# Altium schematic sheet ffultra_pyro.SchDoc: Pyro Channel
size A4; ApprovedBy: John Pork; CheckedBy: Michael Mannis; Author: Michael Mannis; DocumentNumber: 1.0; Revision: 1; SheetNumber: 10; SheetTotal: 12
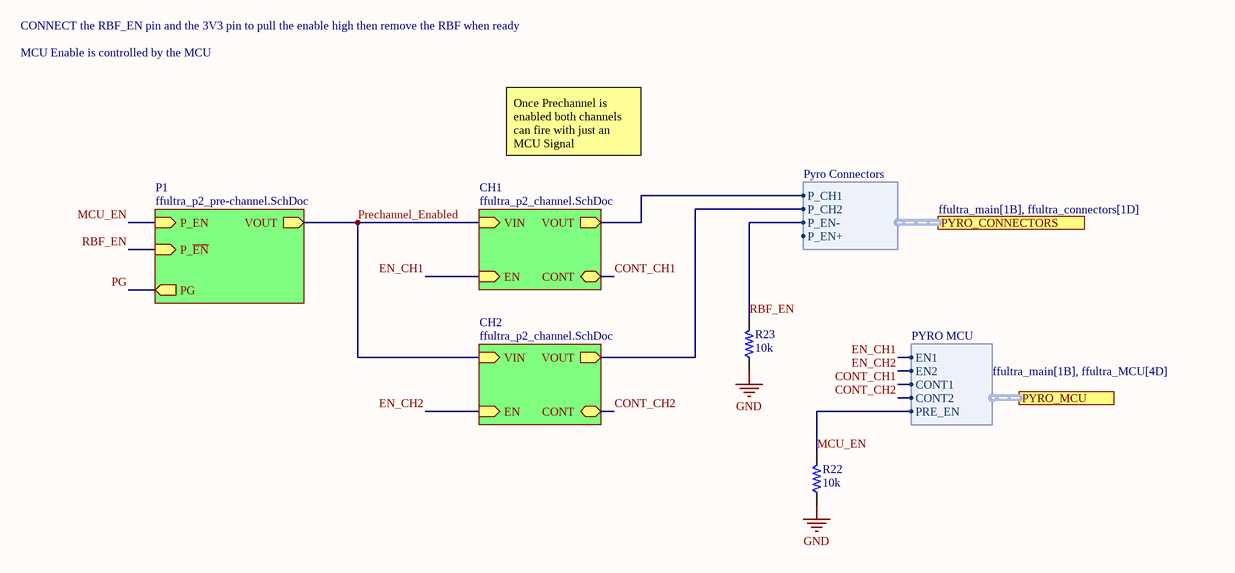
[diagram p0: ffultra_pyro.SchDoc]

## Parts
R22  value 10k  [RES-0402]  (hidden comment: 0402WGF1002TCE)
R23  value 10k  [RES-0402]  (hidden comment: 0402WGF1002TCE)

## Sub-sheets
CH1 = ffultra_p2_channel.SchDoc: VOUT (out), VIN (in), CONT (bidir), EN (in)
CH2 = ffultra_p2_channel.SchDoc: VOUT (out), VIN (in), EN (in), CONT (bidir)
P1 = ffultra_p2_pre-channel.SchDoc: VOUT (out), P_EN (in), P_~{EN} (in), PG (out)

## Ports
PYRO_CONNECTORS (harness Pyro Connectors, see ffultra_main[1B], ffultra_connectors[1D]), PYRO_MCU (harness PYRO MCU, see ffultra_main[1B], ffultra_MCU[4D])

## Harnesses
Pyro Connectors: P_CH1, P_CH2, P_EN-, P_EN+
PYRO MCU: PRE_EN, CONT2, CONT1, EN2, EN1

## Nets
GND: R22.1 R23.1
CONT_CH1: sheet CH1/CONT, port PYRO_MCU.CONT1
CONT_CH2: sheet CH2/CONT, port PYRO_MCU.CONT2
EN_CH1: sheet CH1/EN, port PYRO_MCU.EN1
EN_CH2: sheet CH2/EN, port PYRO_MCU.EN2
MCU_EN: R22.2 ; sheet P1/P_EN, port PYRO_MCU.PRE_EN
PG: sheet P1/PG
Prechannel_Enabled: sheet CH1/VIN, sheet CH2/VIN, sheet P1/VOUT
RBF_EN: R23.2 ; sheet P1/P_~{EN}, port PYRO_CONNECTORS.P_EN-
(unnamed): sheet CH1/VOUT, port PYRO_CONNECTORS.P_CH1
(unnamed): sheet CH2/VOUT, port PYRO_CONNECTORS.P_CH2

## Notes on the sheet
- CONNECT the RBF_EN pin and the 3V3 pin to pull the enable high then remove the RBF when ready
- MCU Enable is controlled by the MCU
- Once Prechannel is enabled both channels can fire with just an MCU Signal

## Library data of the parts
R22 R23 = CMP-009-00191-1: Resistor, 10kΩ, ±1%, 62.5mW, 50V, ±100ppm/℃, -55℃~+155℃, SMD 0402; Manufacturer: Uniroyal; Temperature Rating: -55℃~+155℃; ComponentLink1URL: https://datasheet.lcsc.com/lcsc/2206010100_UNI-ROYAL-Uniroyal-Elec-0402WGF1002TCE_C25744.pdf; Source: jlcpcb_resistors_basic.schlib; Tolerance: 1%; Design Item ID: 0402WGF1002TCE; ComponentLink1Description: Datasheet; ComponentLink2URL: https://jlcpcb.com/partdetail/C25744; Category: Resistors; JLCPCB Part Number: C25744; ComponentLink2Description: JLCPCB Part URL; Temperature Coefficient: ±100ppm/℃; JLCPCB Basic Part: Yes; Power Rating: 62.5mW; Case/Package: 0402; Voltage Rating: 50V; Manufacturer Part Number: 0402WGF1002TCE